# Altium schematic sheet Power_ADP1850_Dual_1.SchDoc (part 1 of 3)
size A3
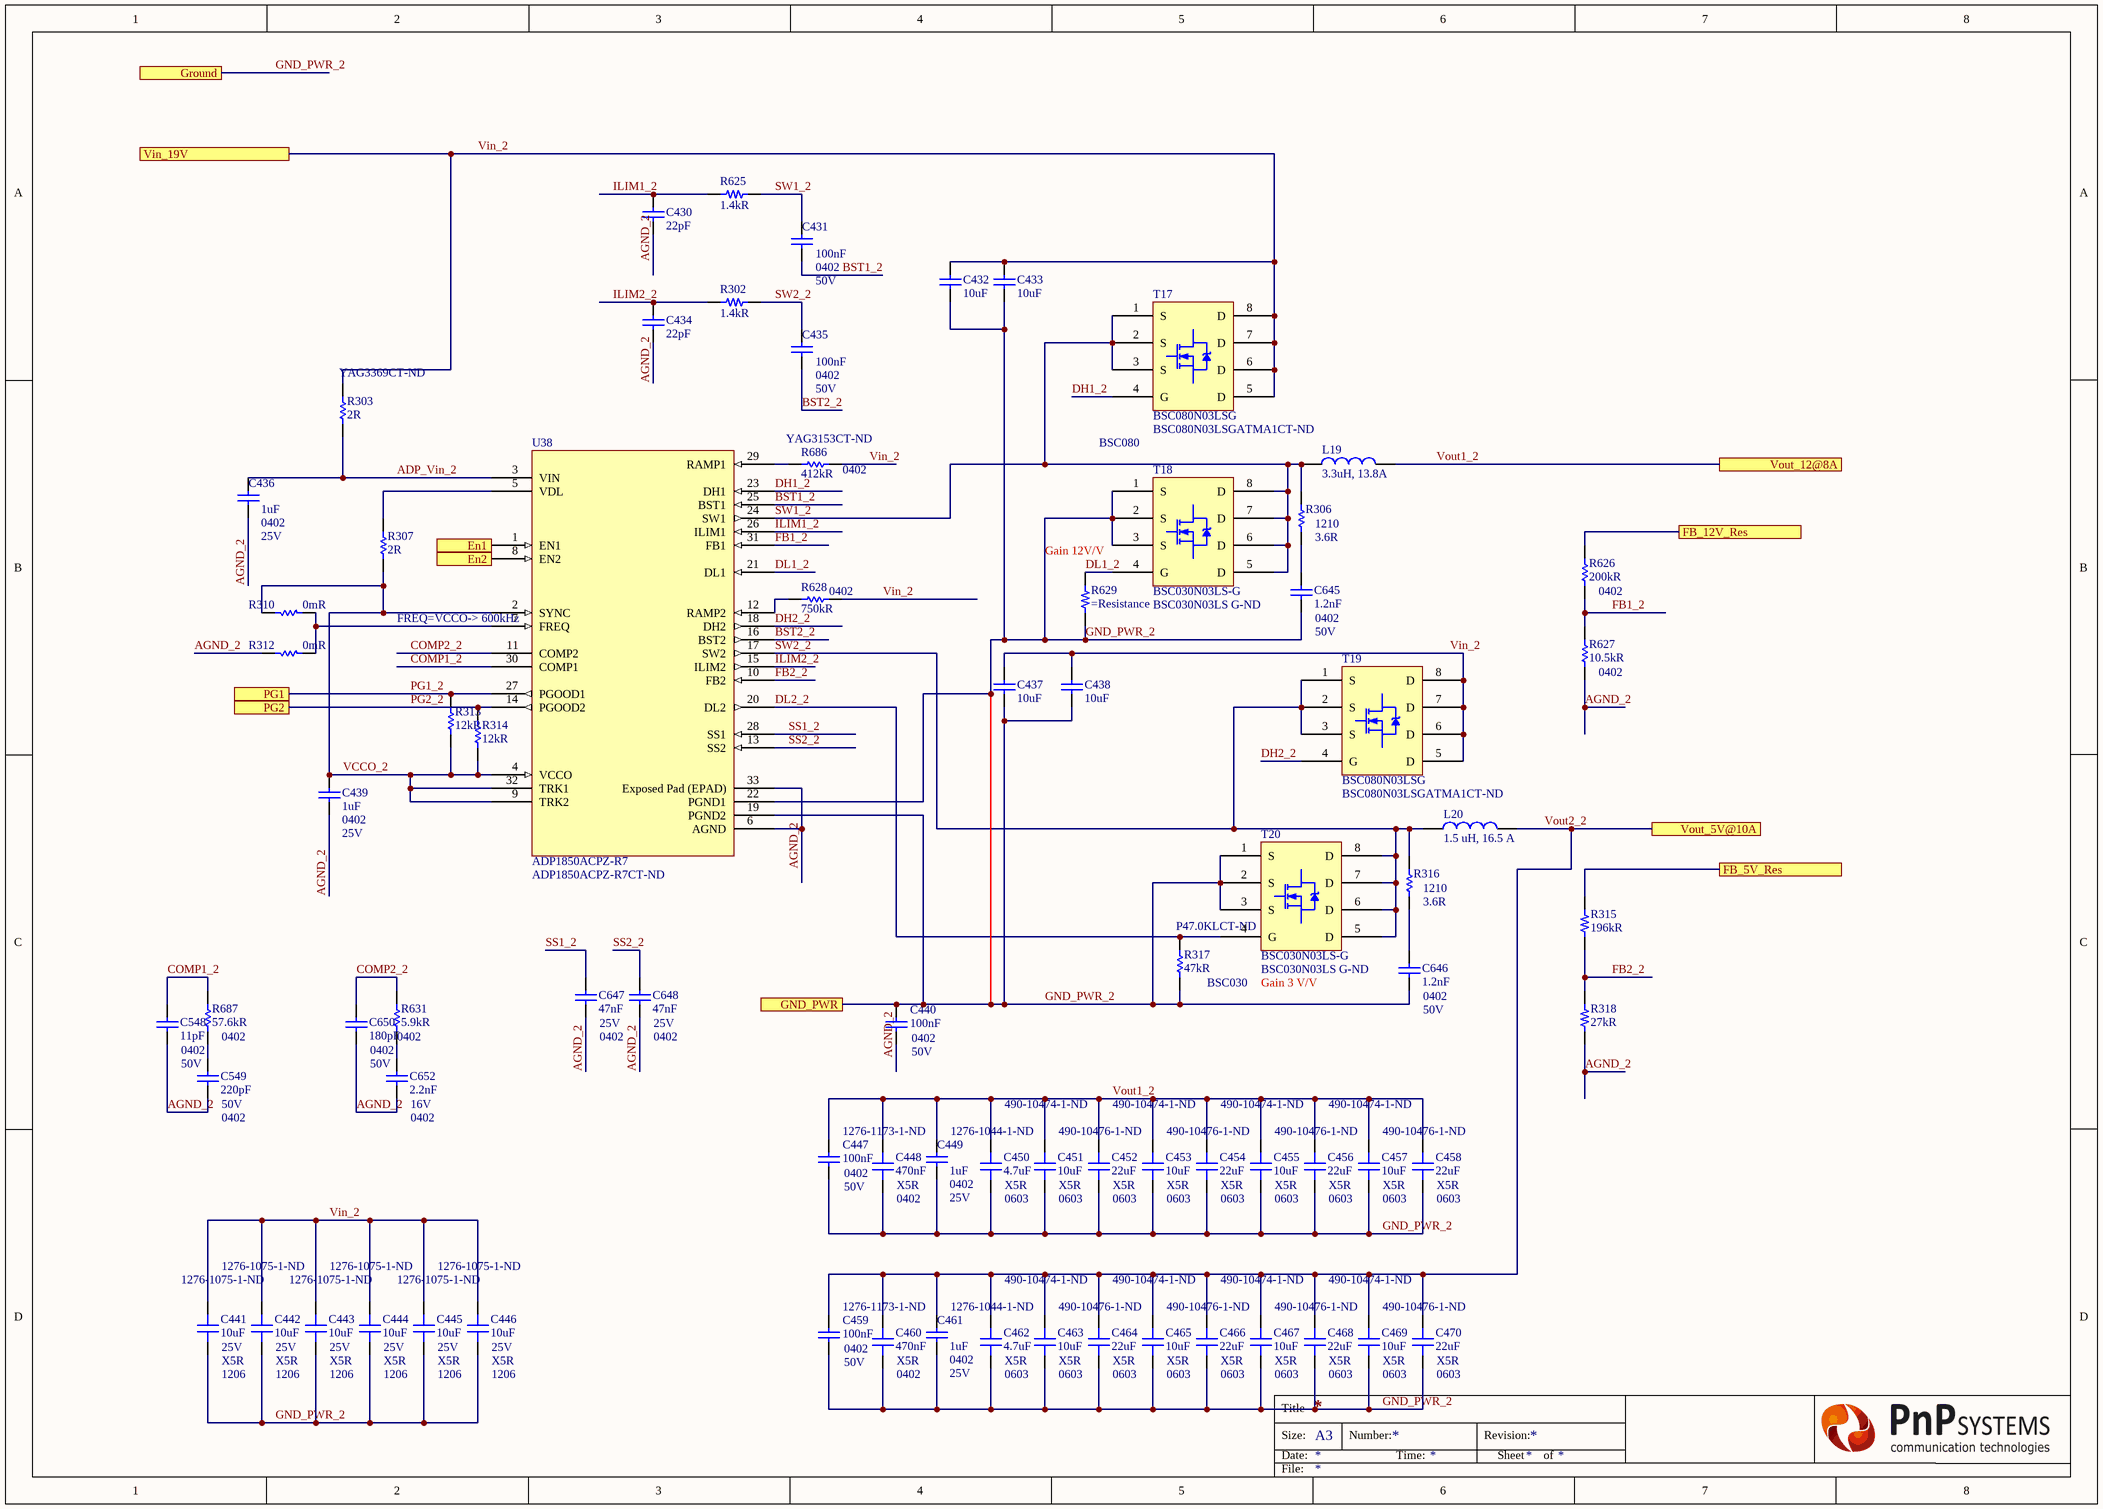
[diagram p0: Power_ADP1850_Dual_1.SchDoc]

## Parts
C430  22pF  [CAP 0402/1005 KK]
C431  100nF  Case Code (Imperial): 0402  Voltage: 50V  [CAP 0402/1005 KK]
C432  10uF  [CAP 1206/3216]
C433  10uF  [CAP 1206/3216]
C434  22pF  [CAP 0402/1005 KK]
C435  100nF  Case Code (Imperial): 0402  Voltage: 50V  [CAP 0402/1005 KK]
C436  1uF  Case/Package: 0402  Voltage Rating: 25V  [CAP 0402/1005 KK]
C437  10uF  [CAP 1206/3216]
C438  10uF  [CAP 1206/3216]
C439  1uF  Case/Package: 0402  Voltage Rating: 25V  [CAP 0402/1005 KK]
C440  100nF  Case Code (Imperial): 0402  Voltage: 50V  [CAP 0402/1005 KK]
C441  10uF  Supplier Part Number 1: 1276-1075-1-ND  Case/Package: 1206  Dielectric: X5R  Voltage: 25V  [CAP 1206/3216 - 0.8MM]
C442  10uF  Supplier Part Number 1: 1276-1075-1-ND  Case/Package: 1206  Dielectric: X5R  Voltage: 25V  [CAP 1206/3216 - 0.8MM]
C443  10uF  Supplier Part Number 1: 1276-1075-1-ND  Case/Package: 1206  Dielectric: X5R  Voltage: 25V  [CAP 1206/3216 - 0.8MM]
C444  10uF  Supplier Part Number 1: 1276-1075-1-ND  Case/Package: 1206  Dielectric: X5R  Voltage: 25V  [CAP 1206/3216 - 0.8MM]
C445  10uF  Supplier Part Number 1: 1276-1075-1-ND  Case/Package: 1206  Dielectric: X5R  Voltage: 25V  [CAP 1206/3216 - 0.8MM]
C446  10uF  Supplier Part Number 1: 1276-1075-1-ND  Case/Package: 1206  Dielectric: X5R  Voltage: 25V  [CAP 1206/3216 - 0.8MM]
C447  100nF  Case Code (Imperial): 0402  Voltage: 50V  [CAP 0402/1005 KK]
C448  470nF  Supplier Part Number 1: 1276-1173-1-ND  Case/Package: 0402  Dielectric: X5R  [CAP 0402/1005 KK]
C449  1uF  Case/Package: 0402  Voltage Rating: 25V  [CAP 0402/1005 KK]
C450  4.7uF  Supplier Part Number 1: 1276-1044-1-ND  Case/Package: 0603  Dielectric: X5R  [CAP 0603/1608 RF]
C451  10uF  Supplier Part Number 1: 490-10474-1-ND  Case/Package: 0603  Dielectric: X5R  [CAP 0603/1608 RF]
C452  22uF  Supplier Part Number 1: 490-10476-1-ND  Case/Package: 0603  Dielectric: X5R  [CAP 0603/1608 RF]
C453  10uF  Supplier Part Number 1: 490-10474-1-ND  Case/Package: 0603  Dielectric: X5R  [CAP 0603/1608 RF]
C454  22uF  Supplier Part Number 1: 490-10476-1-ND  Case/Package: 0603  Dielectric: X5R  [CAP 0603/1608 RF]
C455  10uF  Supplier Part Number 1: 490-10474-1-ND  Case/Package: 0603  Dielectric: X5R  [CAP 0603/1608 RF]
C456  22uF  Supplier Part Number 1: 490-10476-1-ND  Case/Package: 0603  Dielectric: X5R  [CAP 0603/1608 RF]
C457  10uF  Supplier Part Number 1: 490-10474-1-ND  Case/Package: 0603  Dielectric: X5R  [CAP 0603/1608 RF]
C458  22uF  Supplier Part Number 1: 490-10476-1-ND  Case/Package: 0603  Dielectric: X5R  [CAP 0603/1608 RF]
C459  100nF  Case Code (Imperial): 0402  Voltage: 50V  [CAP 0402/1005 KK]
C460  470nF  Supplier Part Number 1: 1276-1173-1-ND  Case/Package: 0402  Dielectric: X5R  [CAP 0402/1005 KK]
C461  1uF  Case/Package: 0402  Voltage Rating: 25V  [CAP 0402/1005 KK]
C462  4.7uF  Supplier Part Number 1: 1276-1044-1-ND  Case/Package: 0603  Dielectric: X5R  [CAP 0603/1608 RF]
C463  10uF  Supplier Part Number 1: 490-10474-1-ND  Case/Package: 0603  Dielectric: X5R  [CAP 0603/1608 RF]
C464  22uF  Supplier Part Number 1: 490-10476-1-ND  Case/Package: 0603  Dielectric: X5R  [CAP 0603/1608 RF]
C465  10uF  Supplier Part Number 1: 490-10474-1-ND  Case/Package: 0603  Dielectric: X5R  [CAP 0603/1608 RF]
C466  22uF  Supplier Part Number 1: 490-10476-1-ND  Case/Package: 0603  Dielectric: X5R  [CAP 0603/1608 RF]
C467  10uF  Supplier Part Number 1: 490-10474-1-ND  Case/Package: 0603  Dielectric: X5R  [CAP 0603/1608 RF]
C468  22uF  Supplier Part Number 1: 490-10476-1-ND  Case/Package: 0603  Dielectric: X5R  [CAP 0603/1608 RF]
C469  10uF  Supplier Part Number 1: 490-10474-1-ND  Case/Package: 0603  Dielectric: X5R  [CAP 0603/1608 RF]
C470  22uF  Supplier Part Number 1: 490-10476-1-ND  Case/Package: 0603  Dielectric: X5R  [CAP 0603/1608 RF]
C548  11pF  Case/Package: 0402  Voltage Rating: 50V  [CAP 0402/1005 KK]
C549  220pF  Case Code (Imperial): 0402  Voltage Rating: 50V  [CAP 0402/1005 KK]
C645  1.2nF  Case/Package: 0402  Voltage Rating (DC): 50V  [CAP 0402/1005 KK]
C646  1.2nF  Case/Package: 0402  Voltage Rating (DC): 50V  [CAP 0402/1005 KK]
C647  47nF  Case Code (Imperial): 0402  Voltage Rating: 25V  [CAP 0402/1005 KK]
C648  47nF  Case Code (Imperial): 0402  Voltage Rating: 25V  [CAP 0402/1005 KK]
C650  180pF  Case Code (Imperial): 0402  Voltage Rating: 50V  [CAP 0402/1005 KK]
C652  2.2nF  Case Code (Imperial): 0402  Voltage Rating: 16V  [CAP 0402/1005 KK]
L19  3.3uH, 13.8A  [WE-CHSA_1011]
L20  1.5 uH, 16.5 A  [WE-HCC_8070]
R302  1.4kR  [RES 0201/0603]
R303  2R  Supplier Part Number 1: YAG3369CT-ND  [RES 0402/1005 RF KK]
R306  value 3.6R  Case/Package: 1210  [RES_1210]  (hidden comment: Resistor_1210)
R307  2R  [RES 0402/1005 RF KK]
R310  0mR  [RES 0402/1005 RF KK]
R312  0mR  [RES 0402/1005 RF KK]
R313  12kR  [RES 0402/1005 RF KK]
R314  12kR  [RES 0402/1005 RF KK]
R315  196kR  [RES 0402/1005 RF KK]
R316  value 3.6R  Case/Package: 1210  [RES_1210]  (hidden comment: Resistor_1210)
R317  47kR  Supplier Part Number 1: P47.0KLCT-ND  [RES 0402/1005 RF KK]
R318  27kR  [RES 0402/1005 RF KK]
R625  1.4kR  [RES 0201/0603]
R626  200kR  Case/Package: 0402  [RES 0402/1005 RF KK]
R627  10.5kR  Case Code (Imperial): 0402  [RES 0402/1005 RF KK]
R628  750kR  Case Code (Imperial): 0402  [RES 0402/1005 RF KK]
R629  (no value)  [RES 0402/1005 RF KK]
R631  5.9kR  Case Code (Imperial): 0402  [RES 0402/1005 RF KK]
R686  412kR  Supplier Part Number 1: YAG3153CT-ND  Case Code (Imperial): 0402  [RES 0402/1005 RF KK]
R687  57.6kR  Case Code (Imperial): 0402  [RES 0402/1005 RF KK]
T17  BSC080N03LSG  Supplier Part Number 1: BSC080N03LSGATMA1CT-ND  [BSC080N03LS]
T18  BSC030N03LS-G  Supplier Part Number 1: BSC030N03LS G-ND  [BSC030N03LS]
T19  BSC080N03LSG  Supplier Part Number 1: BSC080N03LSGATMA1CT-ND  [BSC080N03LS]
T20  BSC030N03LS-G  Supplier Part Number 1: BSC030N03LS G-ND  [BSC030N03LS]
U38  ADP1850ACPZ-R7  Supplier Part Number 1: ADP1850ACPZ-R7CT-ND  [ADP1850]

## Ports
En1, En2, FB_5V_Res, FB_12V_Res, GND_PWR, Ground, PG1, PG2, Vin_19V, Vout_5V@10A, Vout_12@8A

## Nets
ADP_Vin_2: C436.1 R303.2 U38.3(VIN)
AGND_2: C430.1 C434.1 C436.2 C439.2 C440.1 C548.1 C549.1 C647.1 C648.1 C650.1 C652.1 R312.2 R318.1 R627.1 U38.6(AGND) U38.33(Exposed_Pad_(EPAD))
BST1_2: C431.1 U38.25(BST1)
BST2_2: C435.1 U38.16(BST2)
COMP1_2: C548.2 R687.2 U38.30(COMP1)
COMP2_2: C650.2 R631.2 U38.11(COMP2)
DH1_2: T17.4(G) U38.23(DH1)
DH2_2: T19.4(G) U38.18(DH2)
DL1_2: R629.2 T18.4(G) U38.21(DL1)
DL2_2: R317.2 T20.4(G) U38.20(DL2)
En1: U38.1(EN1) ; port En1
En2: U38.8(EN2) ; port En2
FB1_2: R626.1 R627.2 U38.31(FB1)
FB2_2: R315.1 R318.2 U38.10(FB2)
FB_5V_Res: R315.2 ; port FB_5V_Res
FB_12V_Res: R626.2 ; port FB_12V_Res
GND_PWR_2: C432.2 C433.1 C437.1 C438.2 C440.2 C441.1 C442.1 C443.1 C444.1 C445.1 C446.1 C447.1 C448.1 C449.2 C450.1 C451.1 C452.1 C453.1 C454.1 C455.1 C456.1 C457.1 C458.1 C459.1 C460.1 C461.2 C462.1 C463.1 C464.1 C465.1 C466.1 C467.1 C468.1 C469.1 C470.1 C645.1 C646.1 R317.1 R629.1 T18.1(S) T18.2(S) T18.3(S) T20.1(S) T20.2(S) T20.3(S) U38.19(PGND2) U38.22(PGND1) ; port Ground, port GND_PWR
ILIM1_2: C430.2 R625.2 U38.26(ILIM1)
ILIM2_2: C434.2 R302.2 U38.15(ILIM2)
PG1_2: R313.2 U38.27(PGOOD1) ; port PG1
PG2_2: R314.2 U38.14(PGOOD2) ; port PG2
SS1_2: C647.2 U38.28(SS1)
SS2_2: C648.2 U38.13(SS2)
SW1_2: C431.2 L19.1 R306.2 R625.1 T17.1(S) T17.2(S) T17.3(S) T18.5(D) T18.6(D) T18.7(D) T18.8(D) U38.24(SW1)
SW2_2: C435.2 L20.1 R302.1 R316.2 T19.1(S) T19.2(S) T19.3(S) T20.5(D) T20.6(D) T20.7(D) T20.8(D) U38.17(SW2)
VCCO_2: C439.1 R307.2 R310.2 R313.1 R314.1 U38.2(SYNC) U38.4(VCCO) U38.9(TRK2) U38.32(TRK1)
Vin_2: C432.1 C433.2 C437.2 C438.1 C441.2 C442.2 C443.2 C444.2 C445.2 C446.2 R303.1 R628.2 R686.2 T17.5(D) T17.6(D) T17.7(D) T17.8(D) T19.5(D) T19.6(D) T19.7(D) T19.8(D) ; port Vin_19V
Vout1_2: C447.2 C448.2 C449.1 C450.2 C451.2 C452.2 C453.2 C454.2 C455.2 C456.2 C457.2 C458.2 L19.2 ; port Vout_12@8A
Vout2_2: C459.2 C460.2 C461.1 C462.2 C463.2 C464.2 C465.2 C466.2 C467.2 C468.2 C469.2 C470.2 L20.2 ; port Vout_5V@10A
NetC549_2: C549.2 R687.1
NetC645_2: C645.2 R306.1
NetC646_2: C646.2 R316.1
NetC652_2: C652.2 R631.1
NetR307_1: R307.1 U38.5(VDL)
NetR310_1: R310.1 R312.1 U38.7(FREQ)
NetR628_1: R628.1 U38.12(RAMP2)
NetR686_1: R686.1 U38.29(RAMP1)

## Notes on the sheet
- BSC080
- (near R629) Gain 12V/V
- (near U38) FREQ=VCCO-> 600kHz
- BSC030
- (near T20) Gain 3 V/V
- Title
- Size:
- Date:
- A3
- Number:
- Time:
- Revision:
- Sheet
- of
- File: